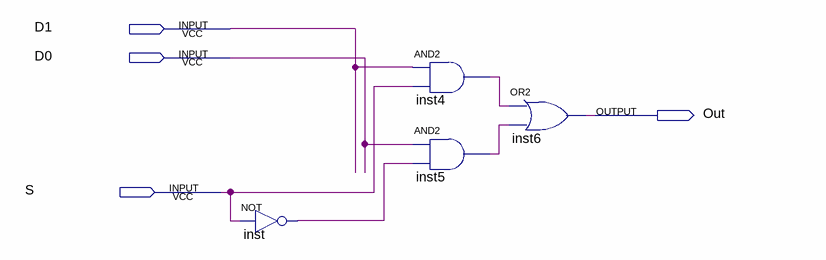
[diagram p0: schematic sheet]
// Quartus schematic TwoOneMux.bdf as structural Verilog: 4 symbols, 4 pins
module TwoOneMux (
  input  D1,
  input  D0,
  input  S,
  output Out
);

  wire inst4_out, inst5_out, inst_out;

  not inst (inst_out, S);
  and inst4 (inst4_out, D1, S);
  and inst5 (inst5_out, D0, inst_out);
  or inst6 (Out, inst4_out, inst5_out);
endmodule
